# Altium schematic sheet MCU.SchDoc: Microcontroller
size A4; ApprovedBy: LD Stanton; Author: LD Stanton; CompanyName: University of Cape Town; DrawnBy: Lawrence Stanton; Engineer: Lawrence Stanton; Organization: University of Cape Town; Address1: Department of Electrical Engineering; Address2: Rondebosch; Address3: Cape Town; Address4: South Africa 7701; DocumentNumber: 5; SheetNumber: 5; SheetTotal: 14
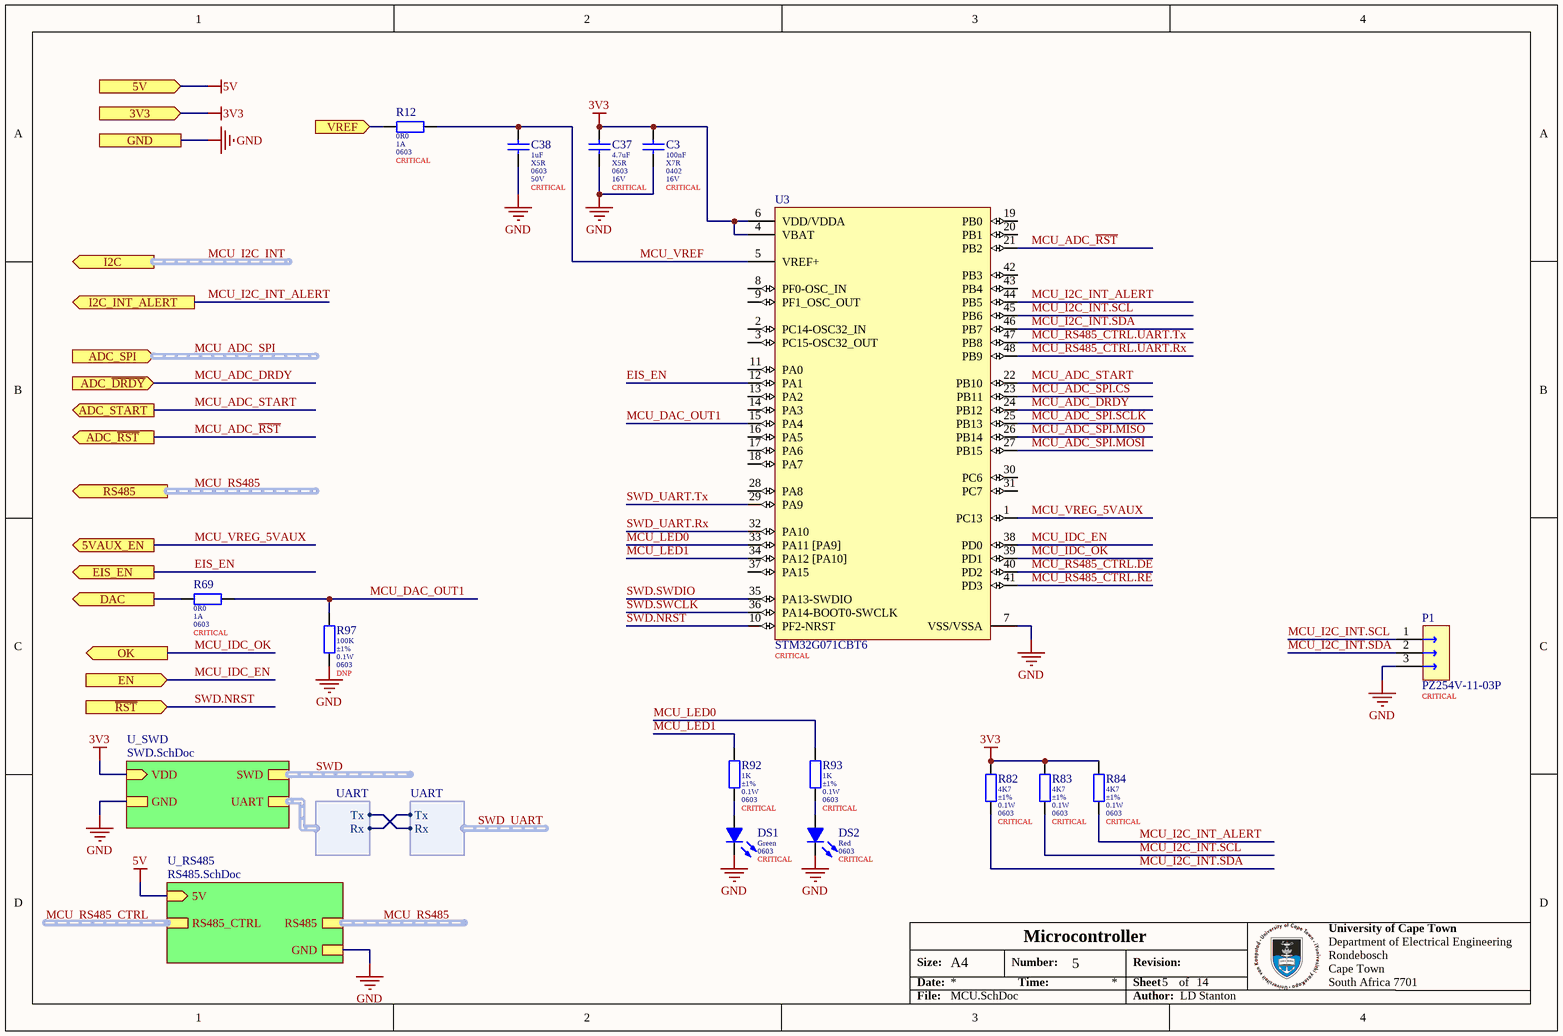
[diagram p0: MCU.SchDoc]

## Parts
C3  value 100nF  Dielectric: X7R  Package: 0402  Voltage: 16V  Populate: CRITICAL  [0402_050_5 (Samsumg) B]  (hidden comment: CL05B104KO5NNNC)
C37  value 4.7uF  Dielectric: X5R  Package: 0603  Voltage: 16V  Populate: CRITICAL  [0603_080_8 (Samsung) B]  (hidden comment: CL10A475KO8NNNC)
C38  value 1uF  Dielectric: X5R  Package: 0603  Voltage: 50V  Populate: CRITICAL  [0603_080_8 (Samsung) B]  (hidden comment: CL10A105KB8NNNC)
DS1  Colour: Green  Package: 0603  Placement: CRITICAL  [LED 0603 (Everlight) B]  (hidden comment: 19-217/GHC-YR1S2/6T)
DS2  Colour: Red  Package: 0603  Placement: CRITICAL  [LED 0603 (Hubei) B]  (hidden comment: KT-0603R)
P1  PZ254V-11-03P  Placement: CRITICAL  [Pin Header 3 1 Male Vertical]
R12  value 0R0  Current: 1A  Package: 0603  Populate: CRITICAL  [0603 (Uniroyal) B]  (hidden comment: 0603WAF0000T5E)
R69  value 0R0  Current: 1A  Package: 0603  Populate: CRITICAL  [0603 (Uniroyal) B]  (hidden comment: 0603WAF0000T5E)
R82  value 4K7  Tolerance: ±1%  Power: 0.1W  Package: 0603  Populate: CRITICAL  [0603 (Uniroyal) B]  (hidden comment: 0603WAF4701T5E)
R83  value 4K7  Tolerance: ±1%  Power: 0.1W  Package: 0603  Populate: CRITICAL  [0603 (Uniroyal) B]  (hidden comment: 0603WAF4701T5E)
R84  value 4K7  Tolerance: ±1%  Power: 0.1W  Package: 0603  Populate: CRITICAL  [0603 (Uniroyal) B]  (hidden comment: 0603WAF4701T5E)
R92  value 1K  Tolerance: ±1%  Power: 0.1W  Package: 0603  Populate: CRITICAL  [0603 (Uniroyal) B]  (hidden comment: 0603WAF1001T5E)
R93  value 1K  Tolerance: ±1%  Power: 0.1W  Package: 0603  Populate: CRITICAL  [0603 (Uniroyal) B]  (hidden comment: 0603WAF1001T5E)
R97  value 100K  Tolerance: ±1%  Power: 0.1W  Package: 0603  Populate: DNP  [0603 (Uniroyal) B]  (hidden comment: 0603WAF1003T5E)
U3  STM32G071CBT6  Placement: CRITICAL  [LQFP48 (STM32G0) B]

## Sub-sheets
U_RS485 = RS485.SchDoc: RS485 (harness RS485), RS485_CTRL (harness RS485_CTRL), 5V (in), GND
U_SWD = SWD.SchDoc: SWD (harness SWD), UART (harness UART), VDD (in), GND

## Ports
3V3 (in), 5V (in), 5VAUX_EN (out), ADC_SPI (in, harness SPI), ADC_START (out), ADC_~{DRDY} (in), ADC_~{RST} (out), DAC (out), EIS_EN (out), EN (in), GND, I2C (out, harness I2C), I2C_INT_ALERT (out), OK (out), RS485 (out, harness RS485), VREF (in), ~{RST} (in)

## Harnesses
UART: Tx, Rx

## Nets
3V3: C3.1 C37.1 R82.1 R83.1 R84.1 U3.4(VBAT) U3.6(VDD/VDDA) ; port 3V3, sheet U_SWD/VDD
5V: port 5V, sheet U_RS485/5V
GND: C3.2 C37.2 C38.2 DS1.K DS2.K P1.3 R97.2 U3.7(VSS/VSSA) ; port GND, sheet U_SWD/GND, sheet U_RS485/GND
DAC: R69.1 ; port DAC
EIS_EN: U3.12(PA1) ; port EIS_EN
MCU_ADC_DRDY: U3.24(PB12) ; port ADC_~{DRDY}
MCU_ADC_~{RST}: U3.21(PB2) ; port ADC_~{RST}
MCU_ADC_SPI~{.}CS: U3.23(PB11)
MCU_ADC_SPI.MISO: U3.26(PB14)
MCU_ADC_SPI.MOSI: U3.27(PB15)
MCU_ADC_SPI.SCLK: U3.25(PB13)
MCU_ADC_START: U3.22(PB10) ; port ADC_START
MCU_DAC_OUT1: R69.2 R97.1 U3.15(PA4)
MCU_I2C_INT.SCL: P1.1 R83.2 U3.45(PB6)
MCU_I2C_INT.SDA: P1.2 R82.2 U3.46(PB7)
MCU_I2C_INT_ALERT: R84.2 U3.44(PB5) ; port I2C_INT_ALERT
MCU_IDC_EN: U3.38(PD0) ; port EN
MCU_IDC_OK: U3.39(PD1) ; port OK
MCU_LED0: R93.1 U3.33(PA11_[PA9])
MCU_LED1: R92.1 U3.34(PA12_[PA10])
MCU_RS485_CTRL.DE: U3.40(PD2)
MCU_RS485_CTRL.~{RE}: U3.41(PD3)
MCU_RS485_CTRL.UART.Rx: U3.48(PB9)
MCU_RS485_CTRL.UART.Tx: U3.47(PB8)
MCU_VREF: C38.1 R12.2 U3.5(VREF+)
MCU_VREG_5VAUX: U3.1(PC13) ; port 5VAUX_EN
SWD.NRST: U3.10(PF2-NRST) ; port ~{RST}
SWD.SWCLK: U3.36(PA14-BOOT0-SWCLK)
SWD.SWDIO: U3.35(PA13-SWDIO)
SWD_UART.Rx: U3.32(PA10)
SWD_UART.Rx: sheet U_SWD/UART.Tx, harness UART.Rx  [a separate net that carries the same name]
SWD_UART.Tx: U3.29(PA9)
SWD_UART.Tx: sheet U_SWD/UART.Rx, harness UART.Tx  [a separate net that carries the same name]
VREF: R12.1 ; port VREF
NetDS1_A: DS1.A R92.2
NetDS2_A: DS2.A R93.2

Not connected (* = marked no-connect by the designer): U3 2(PC14-OSC32_IN) 3(PC15-OSC32_OUT) 8(PF0-OSC_IN) 9(PF1_OSC_OUT) 11(PA0) 13(PA2) 14(PA3) 16(PA5) 17(PA6) 18(PA7) 19(PB0) 20(PB1) 28(PA8) 30(PC6) 31(PC7) 37(PA15) 42(PB3) 43(PB4)

## Buses and harness runs
harness MCU_ADC_SPI = port ADC_SPI
harness MCU_I2C_INT = port I2C
harness MCU_RS485 = port RS485
harness MCU_RS485 = sheet U_RS485/RS485
harness MCU_RS485_CTRL = sheet U_RS485/RS485_CTRL
harness SWD = sheet U_SWD/SWD

## Notes on the sheet
- Size:
- Date:
- A4
- Number:
- Time:
- Revision:
- Sheet
- of
- File:
- Author:

## Library data of the parts
C3 = CMP-045-000014-12: MLCC 100nF 0402 16V X7R ±10%; Manufacturer: Samsung; ComponentLink1Description: Datasheet; ComponentLink1URL: https://datasheet.lcsc.com/szlcsc/Samsung-Electro-Mechanics-CL05C100JB5NNNC_C32949.pdf; LCSC Part Number: C1525; Tolerance: ±10%
C37 = CMP-014-000007-7: MLCC 4.7uF 0603 16V X5R ±10%; Manufacturer: Samsung; ComponentLink1Description: Datasheet; ComponentLink1URL: https://datasheet.lcsc.com/szlcsc/Samsung-Electro-Mechanics-CL05C100JB5NNNC_C32949.pdf; LCSC Part Number: C19666; Tolerance: ±10%
C38 = CMP-045-000002-11: MLCC 1uF 0603 50V X5R ±10%; Manufacturer: Samsung; ComponentLink1URL: https://datasheet.lcsc.com/szlcsc/Samsung-Electro-Mechanics-CL05C100JB5NNNC_C32949.pdf; ComponentLink1Description: Datasheet; Tolerance: ±10%; LCSC Part Number: C15849
DS1 = CMP-007-00001-1: LED 0603 SMT Green; Manufacturer: Everlight; Maximum Forward Current: 25mA; Nominal Forward Voltage: 3V3; ComponentLink1Description: Datasheet; LCSC Part Number: C2986059; ComponentLink1URL: https://datasheet.lcsc.com/szlcsc/Everlight-Elec-19-217-GHC-YR1S2-3T_C72043.pdf
DS2 = CMP-035-000001-5: LED 0603 SMT Red; Manufacturer: Hubei; Maximum Forward Current: 20mA; Nominal Forward Voltage: 2V0; ComponentLink1URL: https://datasheet.lcsc.com/szlcsc/Hubei-KENTO-Elec-KT-0603R_C2286.pdf; LCSC Part Number: C2286; ComponentLink1Description: Datasheet
P1 = CMP-00149-2: Pin Header 3 1 Vertical Male; LCSC Part Number: C2937625; ComponentLink1URL: https://jlcpcb.com/api/file/downloadByFileSystemAccessId/8588954567287443456; ComponentLink1Description: Datasheet
R12 R69 = CMP-010-000359-7: Jumper 0603 1A Uniroyal; Pin Count: 2; ComponentLink1URL: https://datasheet.lcsc.com/szlcsc/1811062009_UNI-ROYAL-Uniroyal-Elec-0603WAF1002T5E_C25804.pdf; Manufacturer: Uniroyal; LCSC Part Number: C21189; Temperature: -55 - 155°C; ComponentLink1Description: Datasheet
R82-R84 = CMP-010-000405-2: Resistor 4K7 0603 ±1% Thick Film Uniroyal; Temperature Coefficient: ±100ppm/K; Working Voltage: 75V; Manufacturer: Uniroyal; ComponentLink1Description: Datasheet; Temperature: -55 - 155°C; ComponentLink1URL: https://datasheet.lcsc.com/szlcsc/1811062009_UNI-ROYAL-Uniroyal-Elec-0603WAF1002T5E_C25804.pdf; LCSC Part Number: C23162
R92 R93 = CMP-010-000308-11: Resistor 1K0 0603 ±1% Thick Film Uniroyal; Working Voltage: 75V; Temperature Coefficient: ±100ppm/K; LCSC Part Number: C21190; ComponentLink1URL: https://datasheet.lcsc.com/szlcsc/1811062009_UNI-ROYAL-Uniroyal-Elec-0603WAF1002T5E_C25804.pdf; Manufacturer: Uniroyal; Pin Count: 2; Temperature: -55 - 155°C; ComponentLink1Description: Datasheet
R97 = CMP-010-000288-10: Resistor 100K 0603 ±1% Thick Film Uniroyal; Temperature Coefficient: ±100ppm/K; Working Voltage: 75V; LCSC Part Number: C25803; Temperature: -55 - 155°C; ComponentLink1URL: https://datasheet.lcsc.com/szlcsc/1811062009_UNI-ROYAL-Uniroyal-Elec-0603WAF1002T5E_C25804.pdf; Pin Count: 2; Manufacturer: Uniroyal; ComponentLink1Description: Datasheet
U3 = CMP-00139-1: MCU 32-bit ARM Cortex M0+ RISC 128KB Flash 1.8V/2.5V/3.3V 48-Pin LQFP Tray; ComponentLink1URL: https://www.st.com/en/microcontrollers-microprocessors/stm32g071cb.html#documentation; ComponentLink2URL: https://www.st.com/resource/en/datasheet/stm32g071cb.pdf; ComponentLink3URL: https://www.st.com/resource/en/application_note/an5096-getting-started-with-stm32g0-series-hardware-development-stmicroelectronics.pdf; Min Operating Temperature: -40°C; Max Operating Temperature: 85°C; ComponentLink2Description: Datasheet; ComponentLink3Description: Hardware Development; ComponentLink1Description: Product Page; LCSC Part Number: C432212